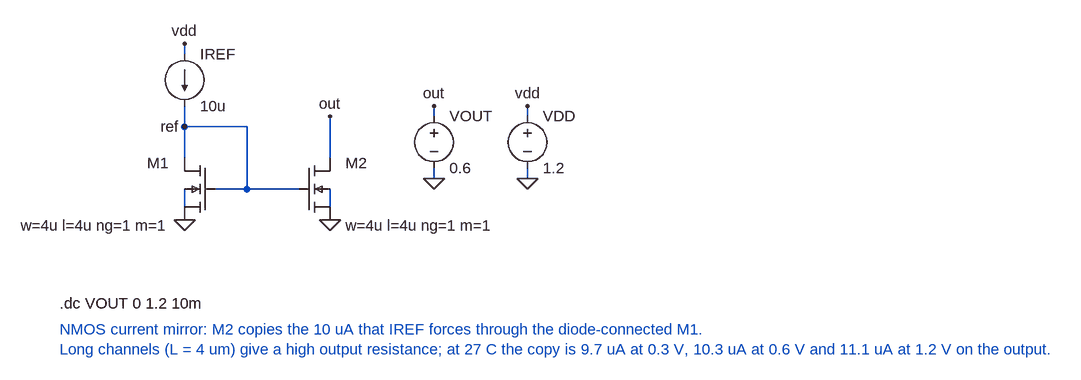
[diagram p0: schematic current_mirror.asc]
current_mirror.asc, the LTspice schematic file:
Version 4
SHEET 1 880 720
WIRE 224 64 224 48
WIRE 224 144 224 224
WIRE 272 272 400 272
WIRE 224 176 320 176
WIRE 320 176 320 272
WIRE 224 272 224 320
WIRE 448 272 448 320
WIRE 448 224 448 160
WIRE 608 160 608 144
WIRE 608 240 608 256
WIRE 752 160 752 144
WIRE 752 240 752 256
FLAG 224 48 vdd
FLAG 224 176 ref
FLAG 224 320 0
FLAG 448 320 0
FLAG 448 160 out
FLAG 608 144 out
FLAG 608 256 0
FLAG 752 144 vdd
FLAG 752 256 0
SYMBOL current 224 64 R0
SYMATTR InstName IREF
SYMATTR Value 10u
SYMBOL sg13g2\sg13_lv_nmos 272 224 M0
WINDOW 0 72 8 Left 2
WINDOW 3 0 0 Invisible 2
WINDOW 39 72 104 Left 2
SYMATTR InstName M1
SYMATTR SpiceLine w=4u l=4u ng=1 m=1
SYMBOL sg13g2\sg13_lv_nmos 400 224 R0
WINDOW 0 72 8 Left 2
WINDOW 3 0 0 Invisible 2
WINDOW 39 72 104 Left 2
SYMATTR InstName M2
SYMATTR SpiceLine w=4u l=4u ng=1 m=1
SYMBOL voltage 608 144 R0
SYMATTR InstName VOUT
SYMATTR Value 0.6
SYMBOL voltage 752 144 R0
SYMATTR InstName VDD
SYMATTR Value 1.2
TEXT 32 448 Left 2 !.dc VOUT 0 1.2 10m
TEXT 32 488 Left 2 ;NMOS current mirror: M2 copies the 10 uA that IREF forces through the diode-connected M1.\nLong channels (L = 4 um) give a high output resistance; at 27 C the copy is 9.7 uA at 0.3 V, 10.3 uA at 0.6 V and 11.1 uA at 1.2 V on the output.

The netlist it stands for:
* current_mirror.asc
IREF vdd ref 10u
XM1 ref ref 0 0 sg13_lv_nmos w=4u l=4u ng=1 m=1  ; pins D G S B
XM2 out ref 0 0 sg13_lv_nmos w=4u l=4u ng=1 m=1  ; pins D G S B
VOUT out 0 0.6
VDD vdd 0 1.2
.dc VOUT 0 1.2 10m
* NMOS current mirror: M2 copies the 10 uA that IREF forces through the diode-connected M1.
* Long channels (L = 4 um) give a high output resistance; at 27 C the copy is 9.7 uA at 0.3 V, 10.3 uA at 0.6 V and 11.1 uA at 1.2 V on the output.
.backanno
.end